# Altium schematic sheet 06_test5.SchDoc
size A3
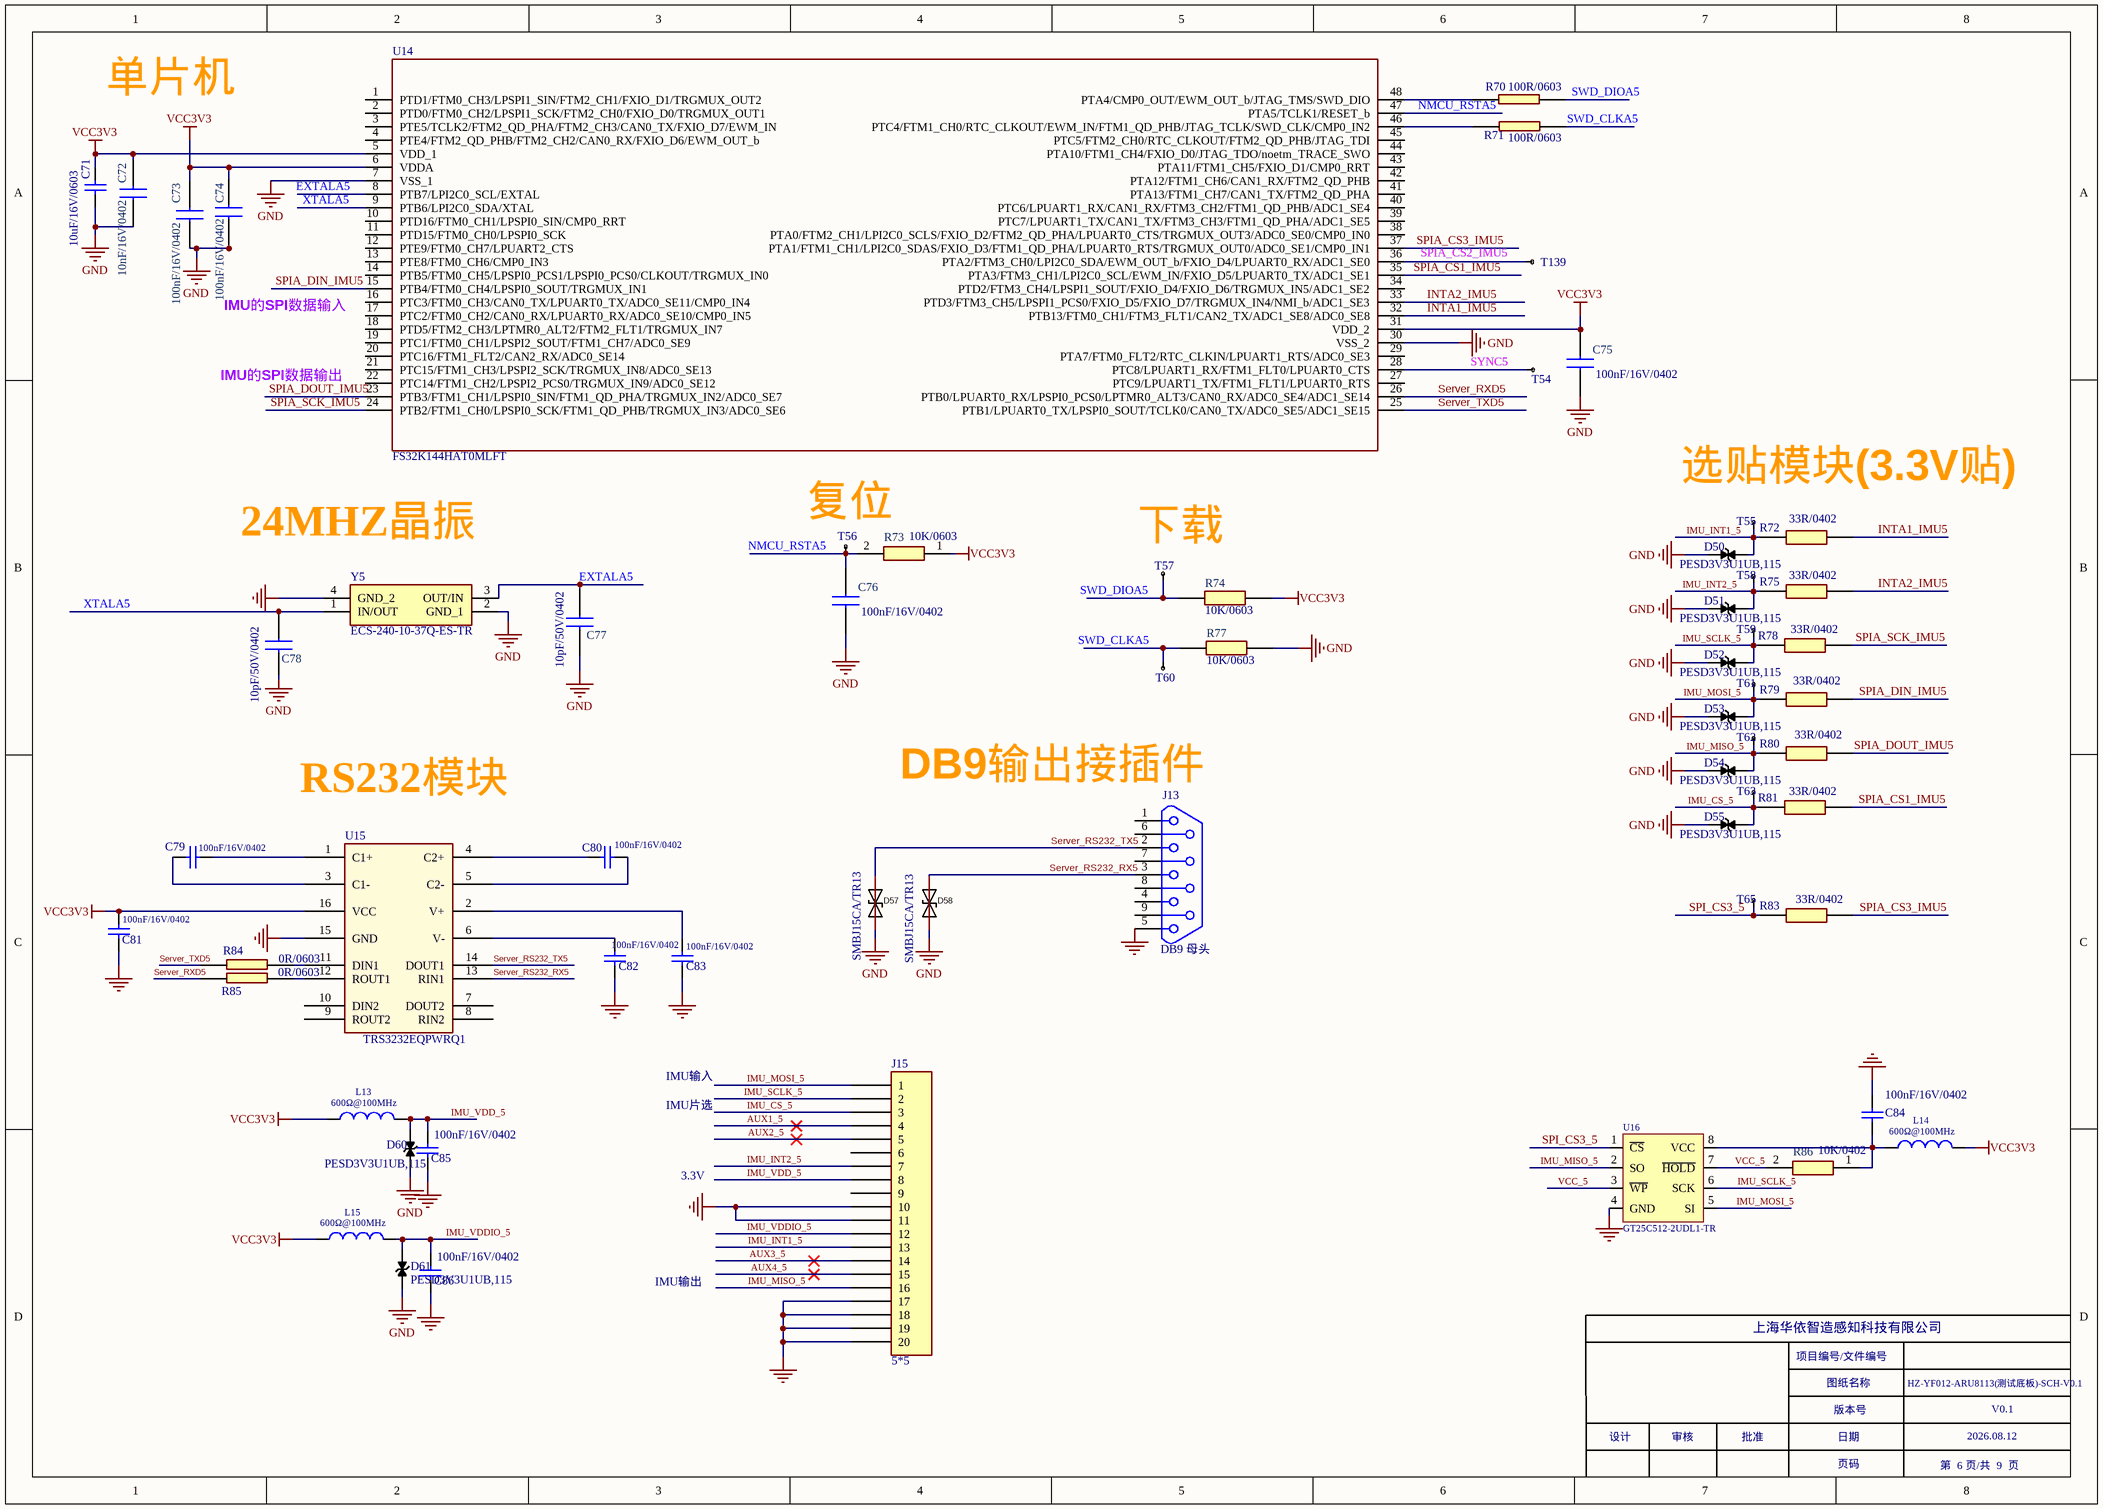
[diagram p0: 06_test5.SchDoc]

## Parts
C71  10uF/16V/0603  [C 0603_L]
C72  10nF/16V/0402  [C 0402_L]
C73  100nF/16V/0402  [C 0402_L]
C74  100nF/16V/0402  [C 0402_L]
C75  100nF/16V/0402  [C 0402_L]
C76  100nF/16V/0402  [C 0402_L]
C77  10pF/50V/0402  [C 0402_L]
C78  10pF/50V/0402  [C 0402_L]
C79  value 100nF/16V/0402  [C 0402_L]  (hidden comment: Cap)
C80  value 100nF/16V/0402  [C 0402_L]  (hidden comment: Cap)
C81  value 100nF/16V/0402  [C 0402_L]  (hidden comment: Cap)
C82  value 100nF/16V/0402  [C 0402_L]  (hidden comment: Cap)
C83  value 100nF/16V/0402  [C 0402_L]  (hidden comment: Cap)
C84  100nF/16V/0402  [C 0402_L]
C85  100nF/16V/0402  [C 0402_L]
C86  100nF/16V/0402  [0402C]
D50  PESD3V3U1UB,115  [SOD-523]
D51  PESD3V3U1UB,115  [SOD-523]
D52  PESD3V3U1UB,115  [SOD-523]
D53  PESD3V3U1UB,115  [SOD-523]
D54  PESD3V3U1UB,115  [SOD-523]
D55  PESD3V3U1UB,115  [SOD-523]
D57  SMBJ15CA/TR13  [SMB]
D58  SMBJ15CA/TR13  [SMB]
D60  PESD3V3U1UB,115  [PESD3V3U1UB,115]
D61  PESD3V3U1UB,115  [PESD3V3U1UB,115]
J13  DB9 母头  [DB9-RS8R1-2R77]
J15  5*5  [5*5-socket]
L13  value 600Ω@100MHz  [0603L]  (hidden comment: Inductor)
L14  value 600Ω@100MHz  [0603L]  (hidden comment: Inductor)
L15  value 600Ω@100MHz  [0603L]  (hidden comment: Inductor)
R70  100R/0603  [R 0603_L]
R71  100R/0603  [R 0603_L]
R72  33R/0402  [0402R]
R73  10K/0603  [R 0603_L]
R74  10K/0603  [R 0603_L]
R75  33R/0402  [0402R]
R77  10K/0603  [R 0603_L]
R78  33R/0402  [0402R]
R79  33R/0402  [0402R]
R80  33R/0402  [0402R]
R81  33R/0402  [0402R]
R83  33R/0402  [0402R]
R84  0R/0603  [R 0603_L]
R85  0R/0603  [R 0603_L]
R86  10K/0402  [0402R]
T54  TEST  [Test-0.5mm]  (value not drawn)
T55  TEST  [TEST]  (value not drawn)
T56  TEST  [TEST]  (value not drawn)
T57  TEST  [TEST]  (value not drawn)
T58  TEST  [TEST]  (value not drawn)
T59  TEST  [TEST]  (value not drawn)
T60  TEST  [TEST]  (value not drawn)
T61  TEST  [TEST]  (value not drawn)
T62  TEST  [TEST]  (value not drawn)
T63  TEST  [TEST]  (value not drawn)
T65  TEST  [TEST]  (value not drawn)
T139  TEST  [Test-0.5mm]  (value not drawn)
U14  FS32K144HAT0MLFT  [LQFP48_7X7]
U15  TRS3232EQPWRQ1  [TSSOP16_640X500]
U16  GT25C512-2UDL1-TR  [GT25C512-2UDLA2-TR]
Y5  ECS-240-10-37Q-ES-TR  [ECS2401037QESTR]

## Nets
GND: C71.2 C72.1 C73.2 C74.2 C75.2 C76.2 C77.1 C78.1 C81.2 C82.2 C83.2 C84.1 C85.2 C86.2 D50.1 D51.1 D52.1 D53.1 D54.1 D55.1 D57.1 D58.1 D60.1 D61.1 J13.5 J15.10 J15.11 J15.17 J15.18 J15.19 J15.20 R77.1 U14.7(VSS_1) U14.30(VSS_2) U15.15(GND) U16.4(GND) Y5.2(GND_1) Y5.4(GND_2)
VCC3V3: C71.1 C72.2 C73.1 C74.1 C75.1 C81.1 L13.1 L14.2 L15.1 R73.1 R74.1 U14.5(VDD_1) U14.6(VDDA) U14.31(VDD_2) U15.16(VCC)
AUX1_5: J15.4
AUX2_5: J15.5
AUX3_5: J15.14
AUX4_5: J15.15
EXTALA5: C77.2 U14.8(PTB7/LPI2C0_SCL/EXTAL) Y5.3(OUT/IN)
IMU_CS_5: D55.2 J15.3 R81.2 T63.1
IMU_INT1_5: D50.2 J15.13 R72.2 T55.1
IMU_INT2_5: D51.2 J15.7 R75.2 T58.1
IMU_MISO_5: D54.2 J15.16 R80.2 T62.1 U16.2(SO)
IMU_MOSI_5: D53.2 J15.1 R79.2 T61.1 U16.5(SI)
IMU_SCLK_5: D52.2 J15.2 R78.2 T59.1 U16.6(SCK)
IMU_VDD_5: C85.1 D60.2 J15.8 L13.2
IMU_VDDIO_5: C86.1 D61.2 J15.12 L15.2
INTA1_IMU5: R72.1 U14.32(PTB13/FTM0_CH1/FTM3_FLT1/CAN2_TX/ADC1_SE8/ADC0_SE8)
INTA2_IMU5: R75.1 U14.33(PTD3/FTM3_CH5/LPSPI1_PCS0/FXIO_D5/FXIO_D7/TRGMUX_IN4/NMI_b/ADC1_SE3)
NMCU_RSTA5: C76.1 R73.2 T56.1 U14.47(PTA5/TCLK1/RESET_b)
Server_RS232_RX5: D58.2 J13.3 U15.13(RIN1)
Server_RS232_TX5: D57.2 J13.2 U15.14(DOUT1)
Server_RXD5: R85.1 U14.26(PTB0/LPUART0_RX/LPSPI0_PCS0/LPTMR0_ALT3/CAN0_RX/ADC0_SE4/ADC1_SE14)
Server_TXD5: R84.1 U14.25(PTB1/LPUART0_TX/LPSPI0_SOUT/TCLK0/CAN0_TX/ADC0_SE5/ADC1_SE15)
SPI_CS3_5: R83.2 T65.1 U16.1(~{CS})
SPIA_CS1_IMU5: R81.1 U14.35(PTA3/FTM3_CH1/LPI2C0_SCL/EWM_IN/FXIO_D5/LPUART0_TX/ADC1_SE1)
SPIA_CS3_IMU5: R83.1 U14.37(PTA1/FTM1_CH1/LPI2C0_SDAS/FXIO_D3/FTM1_QD_PHA/LPUART0_RTS/TRGMUX_OUT0/ADC0_SE1/CMP0_IN1)
SPIA_DIN_IMU5: R79.1 U14.15(PTB4/FTM0_CH4/LPSPI0_SOUT/TRGMUX_IN1)
SPIA_DOUT_IMU5: R80.1 U14.23(PTB3/FTM1_CH1/LPSPI0_SIN/FTM1_QD_PHA/TRGMUX_IN2/ADC0_SE7)
SPIA_SCK_IMU5: R78.1 U14.24(PTB2/FTM1_CH0/LPSPI0_SCK/FTM1_QD_PHB/TRGMUX_IN3/ADC0_SE6)
SWD_CLKA5: R71.2 R77.2 T60.1
SWD_DIOA5: R70.2 R74.2 T57.1
SYNC5: T54.1 U14.28(PTC8/LPUART1_RX/FTM1_FLT0/LPUART0_CTS)
VCC_5: R86.2 U16.3(~{WP}) U16.7(~{HOLD})
XTALA5: C78.2 U14.9(PTB6/LPI2C0_SDA/XTAL) Y5.1(IN/OUT)
NetC79_1: C79.1 U15.3(C1-)
NetC79_2: C79.2 U15.1(C1+)
NetC80_1: C80.1 U15.4(C2+)
NetC80_2: C80.2 U15.5(C2-)
NetC82_1: C82.1 U15.6(V-)
NetC83_1: C83.1 U15.2(V+)
NetC84_2: C84.2 L14.1 R86.1 U16.8(VCC)
NetR70_1: R70.1 U14.48(PTA4/CMP0_OUT/EWM_OUT_b/JTAG_TMS/SWD_DIO)
NetR71_1: R71.1 U14.46(PTC4/FTM1_CH0/RTC_CLKOUT/EWM_IN/FTM1_QD_PHB/JTAG_TCLK/SWD_CLK/CMP0_IN2)
NetR84_2: R84.2 U15.11(DIN1)
NetR85_2: R85.2 U15.12(ROUT1)
NetT139_1: T139.1 U14.36(PTA2/FTM3_CH0/LPI2C0_SDA/EWM_OUT_b/FXIO_D4/LPUART0_RX/ADC1_SE0)

Not connected (* = marked no-connect by the designer): J13 1 4 6 7 8 9; J15 6 9; U14 1(PTD1/FTM0_CH3/LPSPI1_SIN/FTM2_CH1/FXIO_D1/TRGMUX_OUT2) 2(PTD0/FTM0_CH2/LPSPI1_SCK/FTM2_CH0/FXIO_D0/TRGMUX_OUT1) 3(PTE5/TCLK2/FTM2_QD_PHA/FTM2_CH3/CAN0_TX/FXIO_D7/EWM_IN) 4(PTE4/FTM2_QD_PHB/FTM2_CH2/CAN0_RX/FXIO_D6/EWM_OUT_b) 10(PTD16/FTM0_CH1/LPSPI0_SIN/CMP0_RRT) 11(PTD15/FTM0_CH0/LPSPI0_SCK) 12(PTE9/FTM0_CH7/LPUART2_CTS) 13(PTE8/FTM0_CH6/CMP0_IN3) 14(PTB5/FTM0_CH5/LPSPI0_PCS1/LPSPI0_PCS0/CLKOUT/TRGMUX_IN0) 16(PTC3/FTM0_CH3/CAN0_TX/LPUART0_TX/ADC0_SE11/CMP0_IN4) 17(PTC2/FTM0_CH2/CAN0_RX/LPUART0_RX/ADC0_SE10/CMP0_IN5) 18(PTD5/FTM2_CH3/LPTMR0_ALT2/FTM2_FLT1/TRGMUX_IN7) 19(PTC1/FTM0_CH1/LPSPI2_SOUT/FTM1_CH7/ADC0_SE9) 20(PTC16/FTM1_FLT2/CAN2_RX/ADC0_SE14) 21(PTC15/FTM1_CH3/LPSPI2_SCK/TRGMUX_IN8/ADC0_SE13) 22(PTC14/FTM1_CH2/LPSPI2_PCS0/TRGMUX_IN9/ADC0_SE12) 27(PTC9/LPUART1_TX/FTM1_FLT1/LPUART0_RTS) 29(PTA7/FTM0_FLT2/RTC_CLKIN/LPUART1_RTS/ADC0_SE3) 34(PTD2/FTM3_CH4/LPSPI1_SOUT/FXIO_D4/FXIO_D6/TRGMUX_IN5/ADC1_SE2) 38(PTA0/FTM2_CH1/LPI2C0_SCLS/FXIO_D2/FTM2_QD_PHA/LPUART0_CTS/TRGMUX_OUT3/ADC0_SE0/CMP0_IN0) 39(PTC7/LPUART1_TX/CAN1_TX/FTM3_CH3/FTM1_QD_PHA/ADC1_SE5) 40(PTC6/LPUART1_RX/CAN1_RX/FTM3_CH2/FTM1_QD_PHB/ADC1_SE4) 41(PTA13/FTM1_CH7/CAN1_TX/FTM2_QD_PHA) 42(PTA12/FTM1_CH6/CAN1_RX/FTM2_QD_PHB) 43(PTA11/FTM1_CH5/FXIO_D1/CMP0_RRT) 44(PTA10/FTM1_CH4/FXIO_D0/JTAG_TDO/noetm_TRACE_SWO) 45(PTC5/FTM2_CH0/RTC_CLKOUT/FTM2_QD_PHB/JTAG_TDI); U15 7(DOUT2) 8(RIN2) 9(ROUT2) 10(DIN2)

## Notes on the sheet
- 单片机
- IMU的SPI数据输入
- IMU的SPI数据输出
- 选贴模块(3.3V贴)
- (near Y5) 24MHZ晶振
- (near T56) 复位
- (near T57) 下载
- DB9输出接插件
- (near U15) RS232模块
- IMU输入
- IMU片选
- 3.3V
- IMU输出
- 上海华依智造感知科技有限公司
- 项目编号/文件编号
- 图纸名称
- HZ-YF012-ARU8113(测试底板)-SCH-V0.1
- 设计
- 审核
- 批准
- 版本号
- 日期
- 2026.08.12
- V0.1
- 页码
- 第  6 页/共  9  页
- Labels drawn without touching a wire or pin: SPIA_CS2_IMU5

## Library data of the parts
C71 = Cap: SMD/SMT 10UF 16V 20% 0603; Published: 8-Jun-2000; LatestRevisionDate: 17-Jul-2002; LatestRevisionNote: Re-released for DXP Platform.; PackageReference: RAD-0.3; Publisher: Altium Limited; PackageDescription: Radial Cap, Thru-Hole; 2 Leads; 0.3 in Pin Spacing; Value: 10uF/16V
C72-C78 = 0402Capacitor: Capacitor; Manufacturer_Name: Murata Electronics; Manufacturer_Part_Number: GCM155R71C104KA55D; Datasheet Link: https://componentsearchengine.com//GCM155R71C104KA55D.pdf; Height: 0.55mm; Mouser2 Part Number: 81-GCM155R71C104KA5D; Mouser2 Price/Stock: https://www.mouser.com/Search/Refine.aspx?Keyword=81-GCM155R71C104KA5D
C79-C86 = Cap: '100nF/16V/10%/ 0402/X7R / -55℃ ～ 125℃/AEC-Q200; Published: 8-Jun-2000; LatestRevisionDate: 17-Jul-2002; LatestRevisionNote: Re-released for DXP Platform.; PackageReference: RAD-0.3; Publisher: Altium Limited; PackageDescription: Radial Cap, Thru-Hole; 2 Leads; 0.3 in Pin Spacing
  C84-C86: Value: 100nF/16V/0402
D50-D55 D60 D61 = SMBJ36CA: 双向TVS管；600W表面贴装瞬态电压抑制器,工作电压36V，SMB_DO-214AA封装 DIODES
D57 D58 = SMBJ15CA/TR13_C78410: Manufacturer: Brightking(君耀电子); Symbol: SMBJ15CA-C78410; Add into BOM: yes; polarity: 双向; Reverse Stand-Off Voltage (Vrwm): 15V; Maximum Clamping Voltage: 24.4V; Peak Pulse Current (Ipp)@10/1000us: 24.6A; Peak Pulse Power Dissipation (Ppp)@10/1000us: 600W; Breakdown Voltage: 16.7V; Type: TVS; Device: SMBJ15CA/TR13_C78410; LCSC Part Name: 双向 15V截止 24.6A峰值脉冲; Supplier Part: C78410; Manufacturer Part: SMBJ15CA/TR13; Supplier Footprint: SMB(DO-214AA); JLCPCB Part Class: Extended Part; Datasheet: https://atta.szlcsc.com/upload/public/pdf/source/20181127/C309995_EB3DFB9F9AEE5D2146ECD9FA5992A402.pdf; Supplier: LCSC; Convert to PCB: yes
J13 = DB9
L13-L15 = Inductor: Code_IEC: 1005; Published: 8-Jun-2000; LatestRevisionDate: 29-May-2009; LatestRevisionNote: IPC-7351 Footprint Added.; PackageReference: 0402-A; Publisher: Altium Limited; PackageDescription: Chip Inductor; Code_JEITA: 0402
R70 R71 R84 R85 = 0402
R72-R75 R77-R81 R83 R86 = 0402Resistor: Resistor; Manufacturer_Name: KOA Speer; Manufacturer_Part_Number: RN73H1ETTP1002F50; Datasheet Link: https://www.mouser.fr/datasheet/2/219/RN73H-12200.pdf; Height: 0.4mm
U14 = FS32K144HAT0MLFT: Integrated Circuit; Manufacturer_Name: NXP; Datasheet Link: http://www.nxp.com/docs/en/data-sheet/S32K-DS.pdf; Height: 1.6mm; Manufacturer_Part_Number: FS32K144HAT0MLFT
U16 = GT25C512-2UDLA2-TR
Y5 = ECS-240-10-37Q-ES-TR: Crystal or Oscillator; Manufacturer_Name: ECS; Datasheet Link: https://www.ecsxtal.com/store/pdf/ECX-1637Q.pdf; Height: 0.55mm; Manufacturer_Part_Number: ECS-240-10-37Q-ES-TR